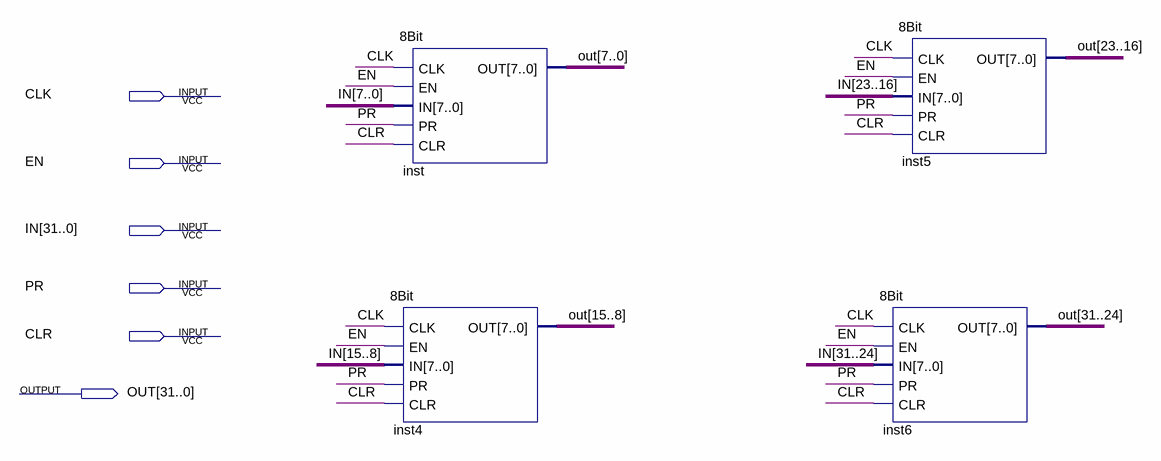
[diagram p0: schematic sheet]
// Quartus schematic 32Bit.bdf as structural Verilog: 4 symbols, 6 pins
module \32Bit  (
  input  CLK,
  input  EN,
  input  [31:0] IN,
  input  PR,
  input  CLR,
  output [31:0] OUT
);

  \8Bit  inst (.CLK(CLK), .EN(EN), .IN(IN[7:0]), .PR(PR), .CLR(CLR), .OUT(OUT[7:0]));
  \8Bit  inst4 (.CLK(CLK), .EN(EN), .IN(IN[15:8]), .PR(PR), .CLR(CLR), .OUT(OUT[15:8]));
  \8Bit  inst5 (.CLK(CLK), .EN(EN), .IN(IN[23:16]), .PR(PR), .CLR(CLR), .OUT(OUT[23:16]));
  \8Bit  inst6 (.CLK(CLK), .EN(EN), .IN(IN[31:24]), .PR(PR), .CLR(CLR), .OUT(OUT[31:24]));
endmodule
